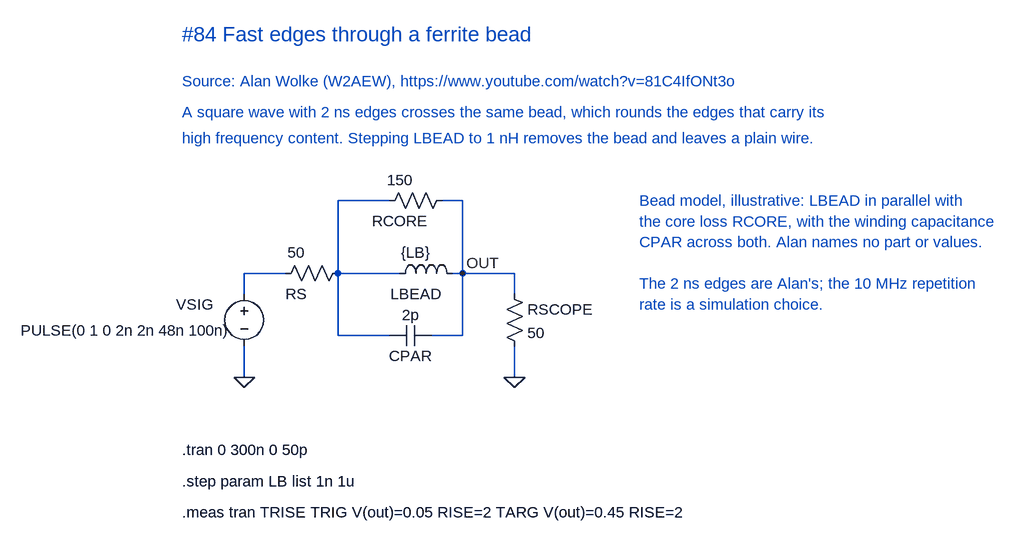
[diagram p0: schematic Ferrite bead fast edges.asc]
Ferrite bead fast edges.asc, the LTspice schematic file:
Version 4.1
SHEET 1 1100 800
WIRE 64 0 64 32
WIRE 128 0 64 0
WIRE 304 0 208 0
WIRE 400 0 384 0
WIRE 480 0 400 0
WIRE 64 112 64 160
WIRE 208 -112 208 0
WIRE 288 -112 208 -112
WIRE 400 -112 368 -112
WIRE 400 0 400 -112
WIRE 208 96 208 0
WIRE 288 96 208 96
WIRE 400 96 352 96
WIRE 400 96 400 0
WIRE 480 32 480 0
WIRE 480 160 480 112
FLAG 64 160 0
FLAG 480 160 0
FLAG 400 0 OUT
SYMBOL voltage 64 16 R0
WINDOW 123 0 0 Left 0
WINDOW 39 0 0 Left 0
WINDOW 0 -48 32 Right 2
WINDOW 3 -344 72 Left 2
SYMATTR InstName VSIG
SYMATTR Value PULSE(0 1 0 2n 2n 48n 100n)
SYMBOL res 112 16 R270
WINDOW 0 0 32 VBottom 2
WINDOW 3 32 32 VTop 2
SYMATTR InstName RS
SYMATTR Value 50
SYMBOL ind 288 16 R270
WINDOW 0 0 40 VBottom 2
WINDOW 3 32 40 VTop 2
SYMATTR InstName LBEAD
SYMATTR Value {LB}
SYMBOL res 272 -96 R270
WINDOW 0 0 32 VBottom 2
WINDOW 3 32 32 VTop 2
SYMATTR InstName RCORE
SYMATTR Value 150
SYMBOL cap 288 112 R270
WINDOW 0 0 32 VBottom 2
WINDOW 3 32 32 VTop 2
SYMATTR InstName CPAR
SYMATTR Value 2p
SYMBOL res 464 16 R0
SYMATTR InstName RSCOPE
SYMATTR Value 50
TEXT -32 -368 Left 3 ;#84 Fast edges through a ferrite bead
TEXT -32 -296 Left 2 ;Source: Alan Wolke (W2AEW), https://www.youtube.com/watch?v=81C4IfONt3o
TEXT -32 -248 Left 2 ;A square wave with 2 ns edges crosses the same bead, which rounds the edges that carry its
TEXT -32 -208 Left 2 ;high frequency content. Stepping LBEAD to 1 nH removes the bead and leaves a plain wire.
TEXT 672 -112 Left 2 ;Bead model, illustrative: LBEAD in parallel with
TEXT 672 -80 Left 2 ;the core loss RCORE, with the winding capacitance
TEXT 672 -48 Left 2 ;CPAR across both. Alan names no part or values.
TEXT 672 16 Left 2 ;The 2 ns edges are Alan's; the 10 MHz repetition
TEXT 672 48 Left 2 ;rate is a simulation choice.
TEXT -32 272 Left 2 !.tran 0 300n 0 50p
TEXT -32 320 Left 2 !.step param LB list 1n 1u
TEXT -32 368 Left 2 !.meas tran TRISE TRIG V(out)=0.05 RISE=2 TARG V(out)=0.45 RISE=2

The netlist it stands for:
* Ferrite bead fast edges.asc
VSIG N001 0 PULSE(0 1 0 2n 2n 48n 100n)
RS N001 N002 50
LBEAD N002 OUT {LB}
RCORE N002 OUT 150
CPAR N002 OUT 2p
RSCOPE OUT 0 50
* #84 Fast edges through a ferrite bead
* Source: Alan Wolke (W2AEW), https://www.youtube.com/watch?v=81C4IfONt3o
* A square wave with 2 ns edges crosses the same bead, which rounds the edges that carry its
* high frequency content. Stepping LBEAD to 1 nH removes the bead and leaves a plain wire.
* Bead model, illustrative: LBEAD in parallel with
* the core loss RCORE, with the winding capacitance
* CPAR across both. Alan names no part or values.
* The 2 ns edges are Alan's; the 10 MHz repetition
* rate is a simulation choice.
.tran 0 300n 0 50p
.step param LB list 1n 1u
.meas tran TRISE TRIG V(out)=0.05 RISE=2 TARG V(out)=0.45 RISE=2
.backanno
.end